# EasyEDA Pro project elisaday-high-color-value-low-cost-reflow-24a201e4.epro, board LCD转接板
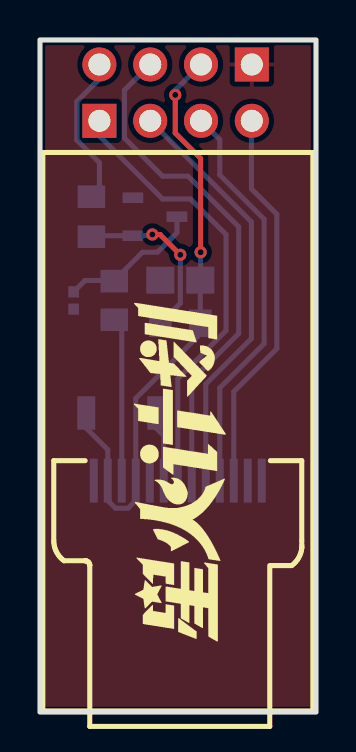
[diagram p5: board, top side]
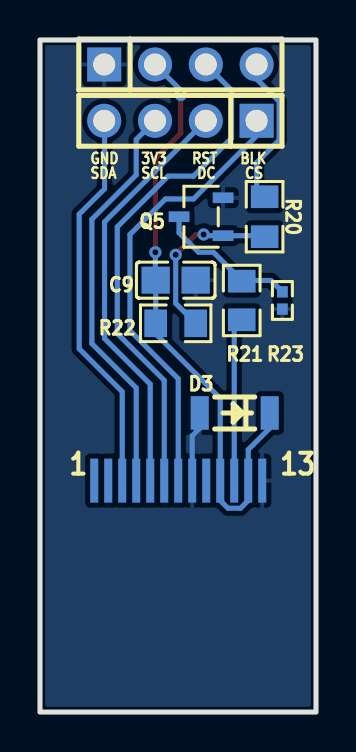
[diagram p6: board, bottom side, seen from below]

Outline 13.8 x 33.64 mm; copper layers: Top Layer, Bottom Layer. Coordinates in mm from the lower left corner of the outline.
Outline path: rectangle 0,33.64 13.8,0
Stack: Top Layer 0.035mm / Dielectric1 1.51mm FR4 er 4.5 / Bottom Layer 0.035mm

## Design rules (mm)
spacing copperThickness1oz (default): track to track 0.102, other pairs 0.152 to 0.3
spacing copperThickness2oz: track to track 0.203, other pairs 0.152 to 0.3
spacing Plane_innerPlane: track to track 0.102, other pairs 0.152 to 0.3
spacing Copper_copperRegion: track to track 0.102, other pairs 0.152 to 0.3
track width copperThickness1oz (default): min 0.127, default 0.254, max 2.54
track width copperThickness2oz: min 0.203, default 0.254, max 2.54
differential pair differentialPair (default): width min 0.127, default 0.254, max 2.54; gap min 0.152, default 0.152
pour e81 uses Copper_copperRegion
pour e101 uses Copper_copperRegion

## Placement (name value [footprint] x y rotation side)
C9  1uF  [C0805]  7.01 21.61 0 bottom
D3  ZMM3V3  [LL-34_L3.5-W1.5-LS3.5-FD]  4.06 14.97 180 bottom
H2  PZ254V-11-04P  [HDR-TH_4P-P2.54-V-M]  6.78 29.59 0 bottom
H3  PZ254V-11-04P  [HDR-TH_4P-P2.54-V-M]  6.78 32.41 180 bottom
Q5  S8050 J3Y(RANGE:200-350)  [SOT-23-3_L3.0-W1.7-P0.95-LS2.9-BR]  5.75 24.79 180 bottom
R20  1kΩ  [R0805]  2.57 24.79 270 bottom
R21  10Ω  [R0805_NEW]  3.71 20.6 270 bottom
R22  10kΩ  [R0805]  7.01 19.45 180 bottom
R23  0Ω  [R0402]  1.68 20.6 90 bottom
U15  N096-1608TBBIG11-H13  [OLED-SMD_ST7735S]  6.89 11.58 0 top

## Footprints (pads in the part's own frame, mm; a bottom-side part is the same pattern mirrored in y, then rotated)
C0805
  rect 1.41x1.35 smd: 1(-1,0) 2(1,0)
HDR-TH_4P-P2.54-V-M
  rect 1.7x1.7 hole 1.1: 1(-3.81,0)
  round 1.7 hole 1.1: 2(-1.27,0) 3(1.27,0) 4(3.81,0)
LL-34_L3.5-W1.5-LS3.5-FD
  rect 0.9x1.677 smd: 1(-1.75,0)
  rect 0.9x1.676 smd: 2(1.75,0)
OLED-SMD_ST7735S
  rect 0.4x2.2 smd far side: 1(4.2,0) 2(3.5,0) 3(2.8,0) 4(2.1,0) 5(1.4,0) 6(0.7,0) 7(0,0) 8(-0.7,0) 9(-1.4,0) 10(-2.1,0) 11(-2.8,0) 12(-3.5,0) 13(-4.2,0)
R0402
  rect 0.566x0.54 smd: 1(-0.433,0) 2(0.433,0)
R0805
  rect 1.133x1.377 smd: 1(-1,0) 2(1,0)
R0805_NEW
  rect 1.133x1.377 smd: 1(-0.966,0) 2(0.966,0)
SOT-23-3_L3.0-W1.7-P0.95-LS2.9-BR
  rect 1.038x0.532 smd: 1(1.101,-0.95) 2(1.101,0.95) 3(-1.101,0)

## Nets
As in the schematic.

Pads without a net: U15 1 2 9

## Via types
v1: diameter 0.61, hole 0.305, Top Layer to Bottom Layer, 4 vias

## Routing (per net, layer and track width the routed paths; a pad name or vN(x,y) marks a point on that pad's centre or on a via; arc(x,y) is an arc through that point)
+3.3V: length 30.8
  Top Layer w0.254: v1(6.76,30.88) 6.76,28.98 8.03,27.71 v1(8.03,23.01)
  Bottom Layer w0.254: v1(6.76,30.88) 6.76,31.12 H3.2 ; D3.2 2.31,14.2 3.39,13.13 U15.12 3.39,10.59 3.77,10.2 4.4,10.2 4.79,10.59 U15.10 4.79,15.7 8.01,18.93 R22.1 C9.2 8.03,21.63 v1(8.03,23.01)
GND: length 3.5
  Bottom Layer w0.254: U15.8 6.19,13.83 5.81,14.2 D3.1
BLK: length 7.7
  Bottom Layer w0.254: R20.1 2.97,26.19 2.97,27.5 1.84,28.62 1.84,30.56 2.97,31.68 H3.4
CS: length 22.4
  Bottom Layer w0.254: H2.1 2.97,28.83 6.13,25.68 7.52,25.68 9.3,23.9 9.3,19.09 6.89,16.68 U15.7
DC: length 21.1
  Bottom Layer w0.254: U15.5 8.29,16.41 10.57,18.69 10.57,24.53 H2.2
RST: length 25.4
  Bottom Layer w0.254: H3.3 4.22,31.12 4.22,28.73 6.13,26.82 7.4,26.82 9.94,24.28 9.94,18.95 7.59,16.6 U15.6
SCL: length 20.2
  Bottom Layer w0.254: U15.4 8.99,16.22 11.21,18.44 11.21,24.66 8.99,26.88 8.99,28.65 H2.3
SDA: length 19.4
  Bottom Layer w0.254: H2.4 10.57,29.57 10.57,26.19 11.84,24.92 11.84,18.18 9.69,16.03 U15.3
$6N4490: length 8.8
  Top Layer w0.254: v1(5.62,23.9) 6,23.9 v1(7.01,22.88)
  Bottom Layer w0.254: v1(7.01,22.88) 7.01,20.45 R22.2 ; v1(5.62,23.9) 5.56,23.84 Q5.1 2.62,23.84 R20.2
$6N4494: length 7.2
  Bottom Layer w0.254: R23.2 2.25,21.6 3.71,21.6 5.13,23.01 5.87,23.01 6.85,23.98 Q5.3
$6N4528: length 8.2
  Bottom Layer w0.254: 3.71,19.6 4.09,19.22 U15.11

## Copper pours and planes (outline as drawn; the poured copper is in the pictures)
GND on Top Layer: -4.7,39.22 18.67,39.22 18.67,-4.34 -4.7,-4.34
GND on Bottom Layer: -1.78,36.43 15.75,36.43 15.75,-3.58 -1.78,-3.58

## Text on the board
Bottom Silkscreen Layer: CS | BLK | DC | RST | 3V3 | SCL | GND | SDA | 13 | 1
